# Altium project test.PrjPcb
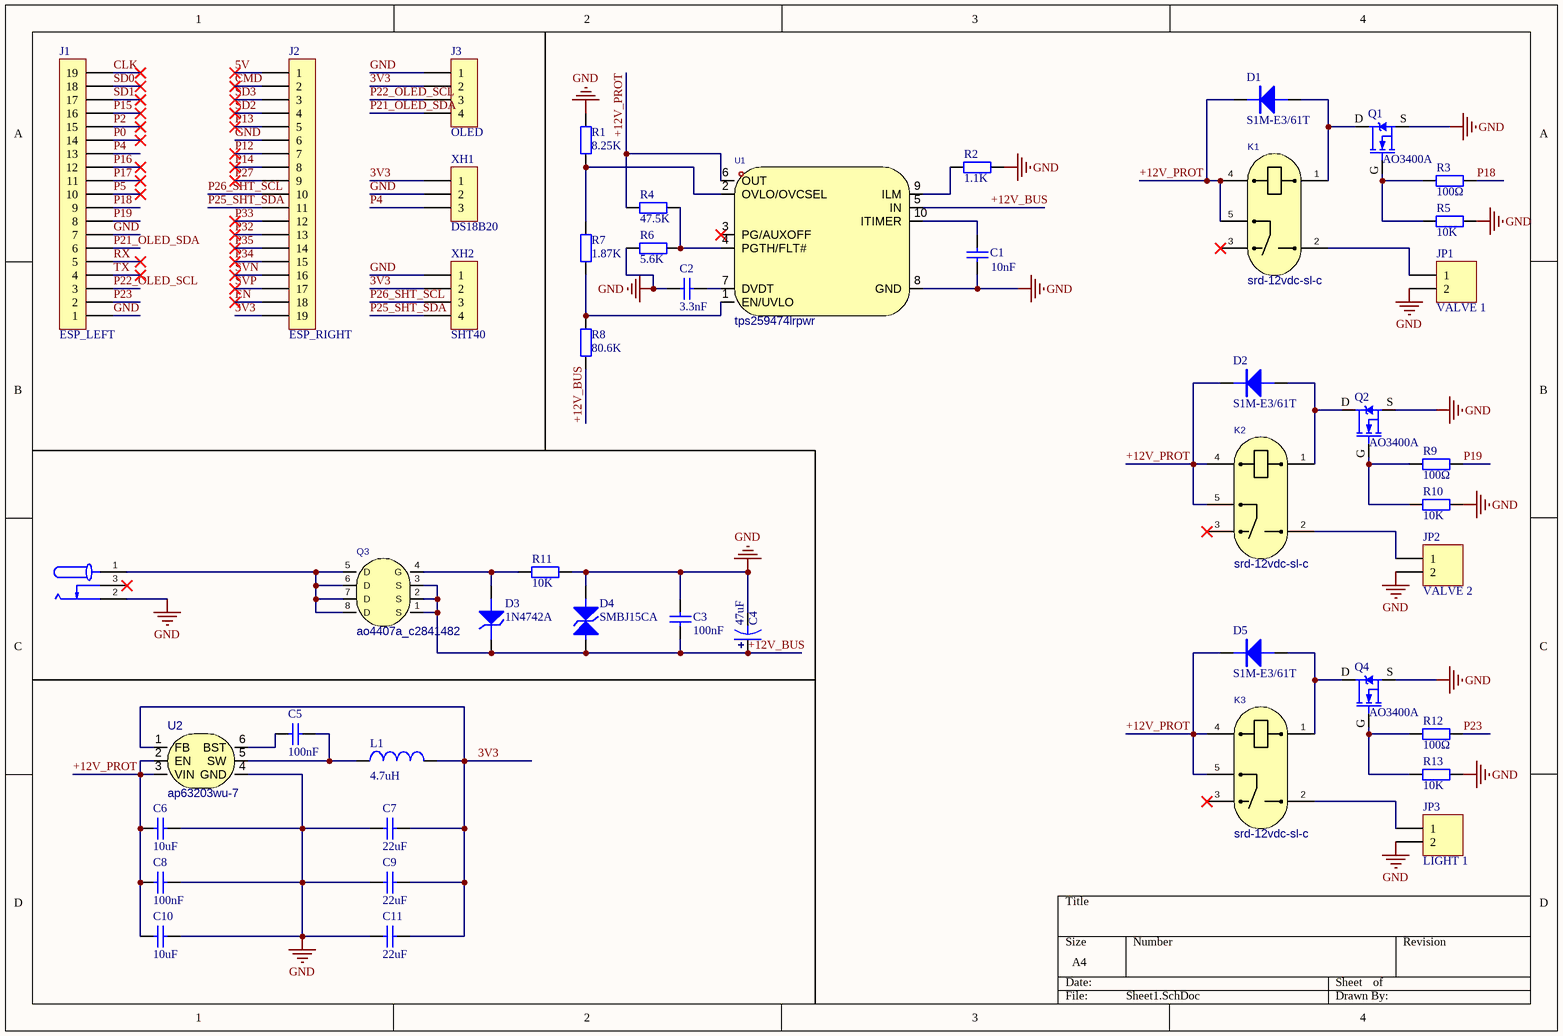
[diagram p0: Sheet1.SchDoc]
1 sheet, 48 parts. Net scope: global (net labels, ports and power ports of the same name join across sheets).
Board file: PCB1.PcbDoc

## Sheet Sheet1.SchDoc
size A4; SheetNumber: 1; SheetTotal: 1

### Parts
C1  value 10nF  [C_0603]  (hidden comment: Cap)
C2  value 3.3nF  [C_0603]  (hidden comment: Cap)
C3  value 100nF  [C_0603]  (hidden comment: Cap)
C4  47uF  [CAP-SMD_BD6.3-L6.6-W6.6-FD]
C5  value 100nF  [C_0603]  (hidden comment: Cap)
C6  value 10uF  [C_1210]  (hidden comment: Cap)
C7  value 22uF  [C_1210]  (hidden comment: Cap)
C8  value 100nF  [C_0603]  (hidden comment: Cap)
C9  value 22uF  [C_1210]  (hidden comment: Cap)
C10  value 10uF  [C_1210]  (hidden comment: Cap)
C11  value 22uF  [C_1210]  (hidden comment: Cap)
D1  S1M-E3/61T  [SMA_DO214AC]
D2  S1M-E3/61T  [SMA_DO214AC]
D3  1N4742A  [DO-41]
D4  SMBJ15CA  [SMB/DO-214AA]
D5  S1M-E3/61T  [SMA_DO214AC]
DC1  dc550200-1095-2h  [DC-IN-TH_DC550200-1095-2H]  (value not drawn)
J1  ESP_LEFT  [Fe-HDR1X19/2.54-S]
J2  ESP_RIGHT  [Fe-HDR1X19/2.54-S]
J3  OLED  [Fe-HDR1X4/2.54-S]
JP1  VALVE 1  [CONN-TH_P5.08_KF127-5.08-2P]
JP2  VALVE 2  [CONN-TH_P5.08_KF127-5.08-2P]
JP3  LIGHT 1  [CONN-TH_P5.08_KF127-5.08-2P]
K1  srd-12vdc-sl-c  [RELAY-TH_SRD-XXVDC-XL-C]
K2  srd-12vdc-sl-c  [RELAY-TH_SRD-XXVDC-XL-C]
K3  srd-12vdc-sl-c  [RELAY-TH_SRD-XXVDC-XL-C]
L1  4.7uH  [IND-SMD_L7.0-W6.6]
Q1  AO3400A  [SOT23-3]
Q2  AO3400A  [SOT23-3]
Q3  ao4407a_c2841482  [SOP-8_L5.0-W4.0-P1.27-LS6.0-BL]
Q4  AO3400A  [SOT23-3]
R1  value 8.25K  [R_0603]  (hidden comment: Res2)
R2  value 1.1K  [R_0603]  (hidden comment: Res2)
R3  value 100Ω  [R_0603]  (hidden comment: Res2)
R4  value 47.5K  [R_0603]  (hidden comment: Res2)
R5  value 10K  [R_0603]  (hidden comment: Res2)
R6  value 5.6K  [R_0603]  (hidden comment: Res2)
R7  value 1.87K  [R_0603]  (hidden comment: Res2)
R8  value 80.6K  [R_0603]  (hidden comment: Res2)
R9  value 100Ω  [R_0603]  (hidden comment: Res2)
R10  value 10K  [R_0603]  (hidden comment: Res2)
R11  value 10K  [R_0603]  (hidden comment: Res2)
R12  value 100Ω  [R_0603]  (hidden comment: Res2)
R13  value 10K  [R_0603]  (hidden comment: Res2)
U1  tps259474lrpwr  [VQFN-10_L2.0-W2.0-P0.45-TL]
U2  ap63203wu-7  [TSOT-26_L2.9-W1.6-P0.95-LS2.8-BL]
XH1  DS18B20  [XH3/2.54mm/180]
XH2  SHT40  [XH4/2.54mm/180]

### Nets
GND: C1.1 C2.1 C3.2 C4.2 C6.2 C7.1 C8.2 C9.1 C10.2 C11.1 D4.K DC1.2(-) J1.1 J1.7 J2.6 J3.1 JP1.2 JP2.2 JP3.2 Q1.S Q2.S Q4.S R1.2 R2.1 R5.2 R6.2 R10.2 R11.2 R13.2 U1.8(GND) U2.4(GND) XH1.2 XH2.1
3V3: C7.2 C9.2 C11.2 J2.19 J3.2 L1.2 U2.1(FB) XH1.1 XH2.2
5V: J2.1
+12V_BUS: C3.1 C4.1 D3.K D4.A Q3.1(S) Q3.2(S) Q3.3(S) R8.1 U1.5(IN)
+12V_PROT: C6.1 C8.1 C10.1 D1.K D2.K D5.K K1.4 K1.5 K2.4 K2.5 K3.4 K3.5 R4.2 U1.6(OUT) U2.2(EN) U2.3(VIN)
CLK: J1.19
CMD: J2.2
EN: J2.18
P0: J1.14
P2: J1.15
P4: J1.13 XH1.3
P5: J1.10
P12: J2.7
P13: J2.5
P14: J2.8
P15: J1.16
P16: J1.12
P17: J1.11
P18: J1.9 R3.2
P19: J1.8 R9.2
P21_OLED_SDA: J1.6 J3.4
P22_OLED_SCL: J1.3 J3.3
P23: J1.2 R12.2
P25_SHT_SDA: J2.11 XH2.4
P26_SHT_SCL: J2.10 XH2.3
P27: J2.9
P32: J2.13
P33: J2.12
P34: J2.15
P35: J2.14
RX: J1.5
SD0: J1.18
SD1: J1.17
SD2: J2.4
SD3: J2.3
SVN: J2.16
SVP: J2.17
TX: J1.4
NetC1_2: C1.2 U1.10(ITIMER)
NetC2_2: C2.2 U1.7(DVDT)
NetC5_1: C5.1 L1.1 U2.5(SW)
NetC5_2: C5.2 U2.6(BST)
NetD1_A: D1.A K1.1 Q1.D
NetD2_A: D2.A K2.1 Q2.D
NetD3_A: D3.A Q3.4(G) R11.1
NetD5_A: D5.A K3.1 Q4.D
NetDC1_1: DC1.1(+) Q3.5(D) Q3.6(D) Q3.7(D) Q3.8(D)
NetJP1_1: JP1.1 K1.2
NetJP2_1: JP2.1 K2.2
NetJP3_1: JP3.1 K3.2
NetQ1_G: Q1.G R3.1 R5.1
NetQ2_G: Q2.G R9.1 R10.1
NetQ4_G: Q4.G R12.1 R13.1
NetR1_1: R1.1 R7.2 U1.2(OVLO/OVCSEL)
NetR2_2: R2.2 U1.9(ILM)
NetR4_1: R4.1 R6.1 U1.4(PGTH/FLT#)
NetR7_1: R7.1 R8.2 U1.1(EN/UVLO)

Not connected (* = marked no-connect by the designer): DC1 3*; K1 3*; K2 3*; K3 3*; U1 3(PG/AUXOFF)*

### Library data of the parts
C1-C3 C5-C11 = Cap: Capacitor; Published: 8-Jun-2000; LatestRevisionDate: 17-Jul-2002; LatestRevisionNote: Re-released for DXP Platform.; PackageReference: RAD-0.3; Publisher: Altium Limited; PackageDescription: Radial Cap, Thru-Hole; 2 Leads; 0.3 in Pin Spacing
C4 = Cap_E_SMD: 贴片电解电容; Manufacturer_Name: *; Manufacturer_Part_Number: *
D1 D2 D5 = Diode_Genneral: 普通二极管; Manufacturer_Name: *; Manufacturer_Part_Number: *
D3 = Diode_Zener: 稳压二极管; Manufacturer_Name: *; Manufacturer_Part_Number: *
D4 = Diode_TVS: 双向瞬态抑制二极管; Manufacturer_Name: *; Manufacturer_Part_Number: *
DC1 = dc550200-1095-2h: 连接器类型:DC电源插座;安装方式:弯插;触点外径:6.4mm;额定电流:5A;额定电压:60V;; Manufacturer: HDGC(华德共创); AddInBom: yes; ModelId: 56d1b1affb614907a521073155fd6544; ModelTransform: 417.322,559.054,0,0,0,0,-84.643,-145.667,-118.11; Connector Type: DC电源插座; Outside Contact Diameter: 6.4mm; Current Rating: 5A; Voltage Rating (Max): 60V; Body Height: 11.5mm; Symbol: DC550200-1095-2H; LCSC Part Name: DC电源插座 外径:6.4mm; SupplierPart: C7587689; ManufacturerPart: DC550200-1095-2H; Supplier Footprint: 插件; JLCPCB Part Class: Extended Part; Datasheet: https://item.szlcsc.com/datasheet/DC550200-1095-2H/8703781.html; Supplier: LCSC; ConvertToPcb: yes; FootprintName: DC-IN-TH_DC550200-1095-2H; ModelName: DC-IN-TH_DC550200-1095-2H; Mounting Type: 弯插; Length: 14.2mm; Width: 10.6mm
J1 J2 = FemaleHDR_1X19
J3 = FemaleHDR_1X4
JP1-JP3 = Header 2: Header, 2-Pin; Revision: 17-Jul-2002: Re-released for DXP Platform.; Publisher: Altium Limited
K1-K3 = srd-12vdc-sl-c: 线圈电压:12V;触点形式:一组转换:1C(单刀双掷-转换);触点容量(电阻负载):-;最大切换电压:250V@AC;最大切换电流:15A;; Manufacturer: 松乐; AddInBom: yes; ModelId: d0eda9b8bf8746d18ae810ab88dc78e7; ModelName: RELAY-TH_L19.2-W15.6-H15.8; ModelTransform: 755.904,622.4397,0,0,0,0,34.882,0,-118.11; Coil Voltage: 12V; Coil Rated Power: 360mW; Switching Current(Max): 15A; Coil Type: 无极性-单线圈; Coil Resistance: 400Ω; Contact Resistance: 100mΩ; Operate Time: 10ms; Symbol: SRD-12VDC-SL-C; LCSC Part Name: 单组转换型继电器; SupplierPart: C30431; ManufacturerPart: SRD-12VDC-SL-C; Supplier Footprint: 插件,19.2x15.6mm; JLCPCB Part Class: Extended Part; Datasheet: https://item.szlcsc.com/datasheet/SRD-12VDC-SL-C/31188.html; Supplier: LCSC; ConvertToPcb: yes; FootprintName: RELAY-TH_SRD-XXVDC-XL-C; Contact Form: 一组转换:1C(单刀双掷-转换); Number of Pins: 5; Contact Rating: -; Switching Voltage(Max): 250V@AC; Release Time: 10ms; Length: 19.2mm; Width: 15.6mm; Height: 15.8mm
L1 = Ind_Molded: 一体成型功率电感; Manufacturer_Name: *; Manufacturer_Part_Number: *
Q1 Q2 Q4 = MOSFET_N: N沟道场效应管; Manufacturer_Name: *; Manufacturer_Part_Number: *
Q3 = ao4407a_c2841482: 数量:1个P沟道;漏源电压(Vdss):30V;连续漏极电流(Id):14A;导通电阻(RDS(on)):9.5mΩ@10V；14.7mΩ@4.5V;耗散功率(Pd):3.1W;阈值电压(Vgs(th)):1.8V;; Manufacturer: UMW(友台半导体); AddInBom: yes; ModelId: a3315c1c78f949e6bb82c6eaca1c53c7; ModelName: SOP-8_L5.0-W4.0-H1.8-LS6.2-P1.27; ModelTransform: 244.094,196.85,0,90,0,0,0,0,0; Number: 1个P沟道; Drain to Source Voltage: 30V; Current - Continuous Drain(Id): 14A; Pd - Power Dissipation: 3.1W; Gate Threshold Voltage (Vgs(th)): 1.8V; Gate Charge(Qg): 40nC@10V；20nC@4.5V; Input Capacitance(Ciss): 2.05nF; Reverse Transfer Capacitance (Crss@Vds): 300pF; Output Capacitance(Coss): 330pF; Symbol: AO4407A_C2841482; LCSC Part Name: 1个P沟道 耐压:30V 电流:14A; SupplierPart: C2841482; ManufacturerPart: AO4407A; Supplier Footprint: SOP-8; JLCPCB Part Class: Extended Part; Datasheet: https://item.szlcsc.com/datasheet/AO4407A/3024118.html; Supplier: LCSC; ConvertToPcb: yes; FootprintName: SOP-8_L5.0-W4.0-P1.27-LS6.0-BL; RDS(on): 9.5mΩ@10V；14.7mΩ@4.5V; Operating Temperature: -55℃~+150℃
R1-R13 = Res2: Resistor; Published: 8-Jun-2000; LatestRevisionDate: 17-Jul-2002; LatestRevisionNote: Re-released for DXP Platform.; PackageReference: AXIAL-0.4; Publisher: Altium Limited; PackageDescription: Axial Device, Thru-Hole; 2 Leads; 0.4 in Pin Spacing
U1 = tps259474lrpwr: 通道数:1;工作电压:2.7V~23V;安装方式:表面安装;; Manufacturer: TI(德州仪器); AddInBom: yes; ModelId: c74b11dc6301497d8044a28629695f2c; ModelTransform: 79.1337,78.74,0,0,0,0,0,0,0; FET Type: 内置FET; Number of Lines: 1; Trigger Current: 500mA~6A; RDS(on): 45mΩ; LCSC Part Name: 2.7V至23V、5.5A、28mΩ真反向电流阻断电子保险丝; SupplierPart: C2864845; ManufacturerPart: TPS259474LRPWR; Supplier Footprint: VQFN-10-HR(2x2); JLCPCB Part Class: Extended Part; Datasheet: https://www.ti.com/cn/lit/ds/symlink/tps25947.pdf; Supplier: LCSC; ConvertToPcb: yes; SymbolName: TPS259474LRPWR; FootprintName: VQFN-10_L2.0-W2.0-P0.45-TL; ModelName: VQFN-10_L2.0-W2.0-P0.45-TL; Threshold Voltage: -; Voltage Rating: 2.7V~23V; Reset Voltage: -; Mounting Type: 表面安装; Peak Output Current(Source): -; Peak Output Current(Sink): -; Operating temperature: -40℃~+125℃; Length: 2mm; Width: 2mm; Height: 1mm; Features: 热保护；过流保护；过压钳位保护；欠压锁定；短路保护
U2 = ap63203wu-7: 功能类型:降压型;工作电压:3.8V~32V;输出电压:3.3V;输出电流:2A;输出类型:固定;; Manufacturer: DIODES(美台); AddInBom: yes; ModelId: 72111e290d4d478b9e0e0b94fc1a26b1; ModelTransform: 114.173,110.236,0,0,0,0,0,0,0; Function: 降压型; Output Voltage: 3.3V; Output Current: 2A; Frequency - Switching: 1.1MHz; Synchronous Rectifier: 是; Number of Outputs: 1; Topology: 降压式; Quiescent Current: 22uA; Switch tube (built-in/external): 内置; Output Type: 固定; Symbol: AP63203WU-7; LCSC Part Name: 降压型 2A 3.8V~32V; SupplierPart: C780769; ManufacturerPart: AP63203WU-7; Supplier Footprint: TSOT-23-6; JLCPCB Part Class: Extended Part; Datasheet: https://item.szlcsc.com/datasheet/AP63203WU-7/832852.html; Supplier: LCSC; ConvertToPcb: yes; FootprintName: TSOT-26_L2.9-W1.6-P0.95-LS2.8-BL; ModelName: TSOT-26_L2.9-W1.6-P0.95-LS2.8-BL; Voltage - Supply: 3.8V~32V; Operating Temperature: -40℃~+85℃@(TA); Features: 轻载高效模式；逐波限流；过流保护；EMI优化(抖频模式)；打嗝限流
XH1 = XH3
XH2 = XH4